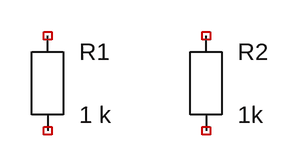
[diagram p0: schematic value_inner_space.asc]
value_inner_space.asc, the LTspice schematic file:
Version 4
SHEET 1 880 680
SYMBOL res 96 160 R0
SYMATTR InstName R1
SYMATTR Value 1 k
SYMBOL res 256 160 R0
SYMATTR InstName R2
SYMATTR Value 1k
SYMATTR SpiceLine tol=5

The netlist it stands for:
* value_inner_space.asc
R1 NC_01 NC_02 1 k
R2 NC_03 NC_04 1k tol=5
.backanno
.end